# Altium project x-fly.PrjPcb
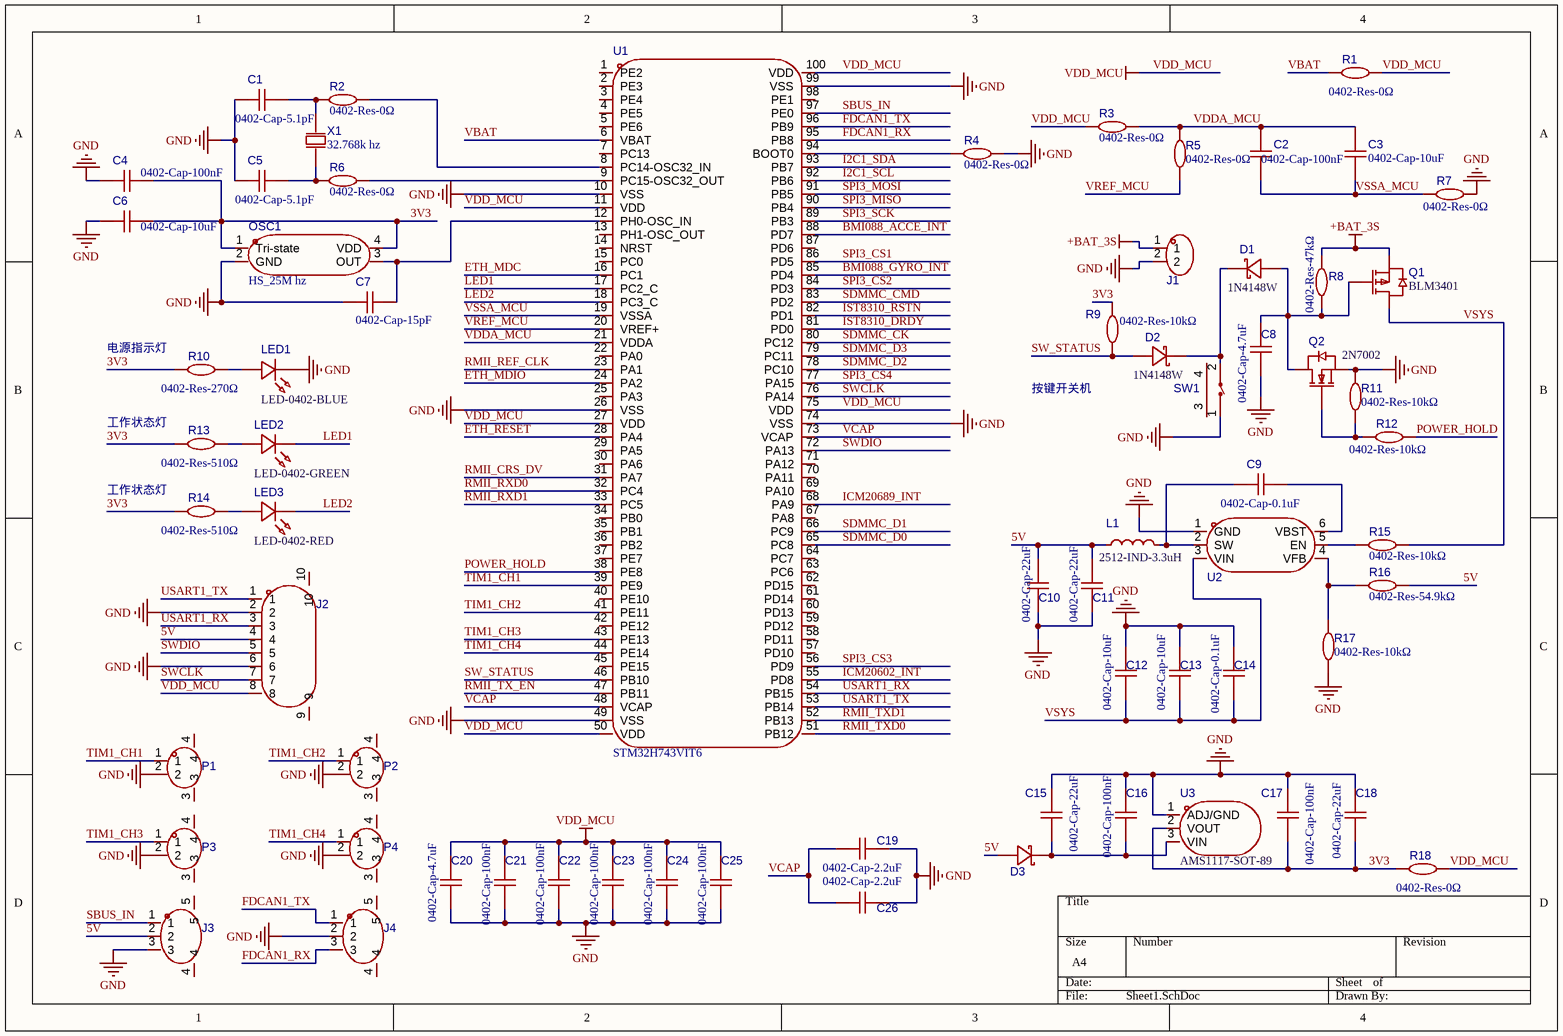
[diagram p0: Sheet1.SchDoc]
3 sheets, 122 parts. Net scope: global (net labels, ports and power ports of the same name join across sheets).
Board file: x-fly_v0.11a.PcbDoc
Sheets:
  Sheet1.SchDoc
  Sheet2.SchDoc
  Sheet3.SchDoc

## Sheet Sheet1.SchDoc: x-fly
size A4; DrawnBy: sushishu; SheetNumber: 1; SheetTotal: 3

### Parts
C1  0402-Cap-5.1pF  [0402-Cap]
C2  0402-Cap-100nF  [0402-Cap]
C3  0402-Cap-10uF  [0402-Cap]
C4  0402-Cap-100nF  [0402-Cap]
C5  0402-Cap-5.1pF  [0402-Cap]
C6  0402-Cap-10uF  [0402-Cap]
C7  0402-Cap-15pF  [0402-Cap]
C8  0402-Cap-4.7uF  [0402-Cap]
C9  0402-Cap-0.1uF  [0402-Cap]
C10  0402-Cap-22uF  [0402-Cap]
C11  0402-Cap-22uF  [0402-Cap]
C12  0402-Cap-10uF  [0402-Cap]
C13  0402-Cap-10uF  [0402-Cap]
C14  0402-Cap-0.1uF  [0402-Cap]
C15  0402-Cap-22uF  [0402-Cap]
C16  0402-Cap-100nF  [0402-Cap]
C17  0402-Cap-100nF  [0402-Cap]
C18  0402-Cap-22uF  [0402-Cap]
C19  0402-Cap-2.2uF  [0402-Cap]
C20  0402-Cap-4.7uF  [0402-Cap]
C21  0402-Cap-100nF  [0402-Cap]
C22  0402-Cap-100nF  [0402-Cap]
C23  0402-Cap-100nF  [0402-Cap]
C24  0402-Cap-100nF  [0402-Cap]
C25  0402-Cap-100nF  [0402-Cap]
C26  0402-Cap-2.2uF  [0402-Cap]
D1  1N4148W  [1N4148W]
D2  1N4148W  [1N4148W]
D3  B5819WS  [B5819WS]  (value not drawn)
J1  XH2.50_2PIN-CZ  [XH2.50_2PIN-CZ]  (value not drawn)
J2  PM1.00-1-8PY  [PM1.00-1-8PY]  (value not drawn)
J3  zx-sh1.0-3pwt  [PM1.00-1-3PY]  (value not drawn)
J4  zx-sh1.0-3pwt  [PM1.00-1-3PY]  (value not drawn)
L1  2512-IND-3.3uH  [2512-IND]
LED1  LED-0402-BLUE  [LED-0402-BLUE]
LED2  LED-0402-GREEN  [LED-0402-GREEN]
LED3  LED-0402-RED  [LED-0402-RED]
OSC1  HS_25M hz  [YXC_HS_25M_3225]
P1  PM1.00-1-2PY  [PM1.00-1-2PY]  (value not drawn)
P2  PM1.00-1-2PY  [PM1.00-1-2PY]  (value not drawn)
P3  PM1.00-1-2PY  [PM1.00-1-2PY]  (value not drawn)
P4  PM1.00-1-2PY  [PM1.00-1-2PY]  (value not drawn)
Q1  BLM3401  [BLM3401]
Q2  2N7002  [2N7002]
R1  0402-Res-0Ω  [0402-Res]
R2  0402-Res-0Ω  [0402-Res]
R3  0402-Res-0Ω  [0402-Res]
R4  0402-Res-0Ω  [0402-Res]
R5  0402-Res-0Ω  [0402-Res]
R6  0402-Res-0Ω  [0402-Res]
R7  0402-Res-0Ω  [0402-Res]
R8  0402-Res-47kΩ  [0402-Res]
R9  0402-Res-10kΩ  [0402-Res]
R10  0402-Res-270Ω  [0402-Res]
R11  0402-Res-10kΩ  [0402-Res]
R12  0402-Res-10kΩ  [0402-Res]
R13  0402-Res-510Ω  [0402-Res]
R14  0402-Res-510Ω  [0402-Res]
R15  0402-Res-10kΩ  [0402-Res]
R16  0402-Res-54.9kΩ  [0402-Res]
R17  0402-Res-10kΩ  [0402-Res]
R18  0402-Res-0Ω  [0402-Res]
SW1  BUTTON-MINI  [button-mini]  (value not drawn)
U1  STM32H743VIT6  [STM32H743VIT6]
U2  TPS563201DDCR  [TPS563201DDCR]  (value not drawn)
U3  AMS1117-SOT-89  [AMS1117-SOT-89]
X1  32.768k hz  [32.768KHZ_2012]

### Nets
+BAT_3S: J1.1 Q1.2(S) R8.2
GND: C1.1 C4.1 C5.1 C6.1 C7.1 C8.1 C10.2 C11.2 C12.1 C13.1 C14.1 C15.2 C16.2 C17.2 C18.2 C19.1 C20.1 C21.1 C22.1 C23.1 C24.1 C25.1 C26.1 J1.2 J2.2 J2.6 J3.3 J4.2 LED1.2 OSC1.2(GND) P1.2 P2.2 P3.2 P4.2 Q2.2(S) R4.2 R7.1 R11.1 R17.1 SW1.1 U1.10(VSS) U1.26(VSS) U1.49(VSS) U1.74(VSS) U1.99(VSS) U2.1(GND) U3.1(ADJ/GND)
VDD_MCU: C20.2 C21.2 C22.2 C23.2 C24.2 C25.2 J2.8 R1.1 R3.1 R18.1 U1.11(VDD) U1.27(VDD) U1.50(VDD) U1.75(VDD) U1.100(VDD)
3V3: C4.2 C6.2 C17.1 C18.1 OSC1.1(Tri-state) OSC1.4(VDD) R9.2 R10.1 R13.1 R14.1 R18.2 U3.2(VOUT)
5V: C10.1 C11.1 D3.1(A) J2.4 J3.2 L1.1 R16.1
BMI088_ACCE_INT: U1.88(PD7)
BMI088_GYRO_INT: U1.85(PD4)
ETH_MDC: U1.16(PC1)
ETH_MDIO: U1.24(PA2)
ETH_RESET: U1.28(PA4)
FDCAN1_RX: J4.3 U1.95(PB8)
FDCAN1_TX: J4.1 U1.96(PB9)
I2C1_SCL: U1.92(PB6)
I2C1_SDA: U1.93(PB7)
ICM20602_INT: U1.55(PD8)
ICM20689_INT: U1.68(PA9)
IST8310_DRDY: U1.81(PD0)
IST8310_RSTN: U1.82(PD1)
LED1: LED2.1(K) U1.17(PC2_C)
LED2: LED3.1(K) U1.18(PC3_C)
POWER_HOLD: R12.1 U1.38(PE8)
RMII_CRS_DV: U1.31(PA7)
RMII_REF_CLK: U1.23(PA1)
RMII_RXD0: U1.32(PC4)
RMII_RXD1: U1.33(PC5)
RMII_TX_EN: U1.47(PB11)
RMII_TXD0: U1.51(PB12)
RMII_TXD1: U1.52(PB13)
SBUS_IN: J3.1 U1.97(PE0)
SDMMC_CK: U1.80(PC12)
SDMMC_CMD: U1.83(PD2)
SDMMC_D0: U1.65(PC8)
SDMMC_D1: U1.66(PC9)
SDMMC_D2: U1.78(PC10)
SDMMC_D3: U1.79(PC11)
SPI3_CS1: U1.86(PD5)
SPI3_CS2: U1.84(PD3)
SPI3_CS3: U1.56(PD9)
SPI3_CS4: U1.77(PA15)
SPI3_MISO: U1.90(PB4)
SPI3_MOSI: U1.91(PB5)
SPI3_SCK: U1.89(PB3)
SW_STATUS: D2.1(A) R9.1 U1.46(PB10)
SWCLK: J2.7 U1.76(PA14)
SWDIO: J2.5 U1.72(PA13)
TIM1_CH1: P1.1 U1.39(PE9)
TIM1_CH2: P2.1 U1.41(PE11)
TIM1_CH3: P3.1 U1.43(PE13)
TIM1_CH4: P4.1 U1.44(PE14)
USART1_RX: J2.3 U1.54(PB15)
USART1_TX: J2.1 U1.53(PB14)
VBAT: R1.2 U1.6(VBAT)
VCAP: C19.2 C26.2 U1.48(VCAP) U1.73(VCAP)
VDDA_MCU: C2.2 C3.2 R3.2 R5.2 U1.21(VDDA)
VREF_MCU: R5.1 U1.20(VREF+)
VSSA_MCU: C2.1 C3.1 R7.2 U1.19(VSSA)
VSYS: C12.2 C13.2 C14.2 Q1.3(D) R15.2 U2.3(VIN)
NetC1_2: C1.2 R2.1 X1.2(OSC2)
NetC5_2: C5.2 R6.1 X1.1(OSC1)
NetC7_2: C7.2 OSC1.3(OUT) U1.12(PH0-OSC_IN)
NetC8_2: C8.2 D1.1(A) Q1.1(G) Q2.3(D) R8.1
NetC9_1: C9.1 U2.6(VBST)
NetC9_2: C9.2 L1.2 U2.2(SW)
NetC15_1: C15.1 C16.1 D3.2(K) U3.3(VIN)
NetD1_2: D1.2(K) D2.2(K) SW1.2
NetLED1_1: LED1.1 R10.2
NetLED2_2: LED2.2(A) R13.2
NetLED3_2: LED3.2(A) R14.2
NetQ2_1: Q2.1(G) R11.2 R12.2
NetR2_2: R2.2 U1.8(PC14-OSC32_IN)
NetR4_1: R4.1 U1.94(BOOT0)
NetR6_2: R6.2 U1.9(PC15-OSC32_OUT)
NetR15_1: R15.1 U2.5(EN)
NetR16_2: R16.2 R17.2 U2.4(VFB)

Not connected (* = marked no-connect by the designer): J2 9 10; J3 4 5; J4 4 5; P1 3 4; P2 3 4; P3 3 4; P4 3 4; SW1 3 4; U1 1(PE2) 2(PE3) 3(PE4) 4(PE5) 5(PE6) 7(PC13) 13(PH1-OSC_OUT) 14(NRST) 15(PC0) 22(PA0) 25(PA3) 29(PA5) 30(PA6) 34(PB0) 35(PB1) 36(PB2) 37(PE7) 40(PE10) 42(PE12) 45(PE15) 57(PD10) 58(PD11) 59(PD12) 60(PD13) 61(PD14) 62(PD15) 63(PC6) 64(PC7) 67(PA8) 69(PA10) 70(PA11) 71(PA12) 87(PD6) 98(PE1)

### Notes on the sheet
- (near R10) 电源指示灯
- 工作状态灯
- 按键开关机

### Library data of the parts
C1-C26 = 0402-Cap: Symbol: CGA0402X5R106M6R3GT
D1 D2 = 1N4148W: 二极管配置:独立式;整流电流:150mA;直流反向耐压(Vr):100V;正向压降(Vf):1.25V@150mA;反向恢复时间(Trr):4ns;; Manufacturer: R+O(宏嘉诚); Symbol: 1N4148W_C7420318; AddInBom: yes; ModelId: 5054d9b7be8b429dad093a54b517b4dd; ModelName: SOD-123_L2.7-W1.6-LS3.7-FD; ModelTransform: 145.669,61.024,0,0,0,0,0,0,0; Diode Configuration: 独立式; Pd - Power Dissipation: 400mW; Current - Rectified: 150mA; Voltage - DC Reverse(Vr): 100V; Non-Repetitive Peak Forward Surge Current: 2A; Reverse Leakage Current (Ir): 1uA@75V; Reverse Recovery Time (trr): 4ns; Operating Junction Temperature Range: -55℃~+150℃; LCSC Part Name: 100V 150mA; SupplierPart: C7420318; ManufacturerPart: 1N4148W; Supplier Footprint: SOD-123; JLCPCB Part Class: Extended Part; Datasheet: https://item.szlcsc.com/datasheet/1N4148W/8397140.html; Supplier: LCSC; ConvertToPcb: yes; FootprintName: SOD-123_L2.7-W1.6-LS3.7-FD; Voltage - Forward(Vf@If): 1.25V@150mA
D3 = B5819WS: 二极管配置:独立式;正向压降(Vf):600mV@1.0A;直流反向耐压(Vr):40V;整流电流:1A;; Manufacturer: R+O(宏嘉诚); Symbol: B5819WS_C7420331; AddInBom: yes; ModelId: 0f2f330c645944df9245ac3c3fec3456; ModelName: SOD-323_L1.7-W1.3-LS2.5-FD; ModelTransform: 98.425,49.2125,0,180,0,0,0,0,0; Diode Configuration: 独立式; Voltage - DC Reverse(Vr): 40V; Current - Rectified: 1A; Reverse Leakage Current (Ir): 1mA@40V; Operating Junction Temperature Range: -55℃~+150℃; Non-Repetitive Peak Forward Surge Current: 10A; LCSC Part Name: 电压:40V 电流:1A; SupplierPart: C7420331; ManufacturerPart: B5819WS; Supplier Footprint: SOD-323; JLCPCB Part Class: Extended Part; Datasheet: https://item.szlcsc.com/datasheet/B5819WS/8397153.html; Supplier: LCSC; ConvertToPcb: yes; FootprintName: SOD-323_L1.7-W1.3-LS2.5-FD; Voltage - Forward(Vf@If): 600mV@1.0A
J1 = XH2.50_2PIN-CZ: 插针结构:1x2P;间距:2.54mm;行距:-;圆针/方针:方针;安装方式:直插;排数:单排;总PIN位数:2P;额定电流:3A;额定电压:-;配合针长度:6mm;塑高:2.5mm;端接针长度:3mm;触头材质:黄铜;触头镀层:金;工作温度:-40℃~+105℃;颜色:黑色;; Manufacturer: Megastar(兆星); Symbol: ZX-PZ2.54-1-2PZZ; AddInBom: yes; ModelId: e35305ec3aa84b66b849f914b715e73f; ModelName: HDR2.54-M-LI-1X2P; ModelTransform: 200,100,0,0,0,0,0,0,-118.11; Pin Structure: 1x2P; Pitch: 2.54mm; Circluar Pins/Square Pins: 方针; Current Rating: 3A; LCSC Part Name: 1x2P 间距:2.54mm 方针 直插; SupplierPart: C7501260; ManufacturerPart: ZX-PZ2.54-1-2PZZ; Supplier Footprint: 插件,P=2.54mm; JLCPCB Part Class: Extended Part; Datasheet: https://item.szlcsc.com/datasheet/ZX-PZ2.54-1-2PZZ/8582473.html; Supplier: LCSC; ConvertToPcb: yes; FootprintName: HDR-TH_2P-P2.54-V-M; Row Spacing: -; Mounting Type: 直插; Number of Rows: 单排; Number of Pins: 2P; Voltage Rating (Max): -; Length of Mating Pin: 6mm; Insulation Height: 2.5mm; Length of End Connection Pin: 3mm; Contact Material: 黄铜; Contact Plating: 金; Operating Temperature: -40℃~+105℃; Color: 黑色
J2 = PM1.00-1-8PY: 插针结构:1x8P;间距:1mm;安装方式:卧贴;参考系列:SH;总PIN数:8P;排数:1;每排PIN数:8;行距:-;额定电流:1A;触头材质:磷铜;触头镀层:锡;工作温度:-40℃~+105℃;; Manufacturer: CJT(长江连接器); ManufacturerPart: A1002WR-S-8P-LCP; Symbol: A1002WR-S-8P; AddInBom: yes; ModelId: 4a02b27f0fd74216a2a7cf264e5e8a60; ModelName: CONN-SMD_SH1.00-WS-8P; ModelTransform: 374.015,196.85,0,0,0,0,0,-6.693,0; Pins Structure: 1x8P; Pitch: 1mm; Reference Series: SH; Number of PINs Per Row: 8; Current Rating: 1A; Voltage Rating: 50V; Plastic Material: LCP; Flame Retardant Rating: UL94V-0; LCSC Part Name: 1x8P 间距:1mm 卧贴 系列:SH; SupplierPart: C239526; Supplier Footprint: SMD,P=1mm,卧贴; JLCPCB Part Class: Extended Part; Datasheet: https://item.szlcsc.com/datasheet/A1002WR-S-8P-LCP/238630.html; Supplier: LCSC; ConvertToPcb: yes; FootprintName: CONN-SMD_A1002WR-S-8P; Mounting Type: 卧贴; Number of Pins: 8P; Number of Rows: 1; Row Spacing: -; Contact Material: 磷铜; Contact Plating: 锡; Operating Temperature: -40℃~+105℃; Color: -
J3 J4 = PM1.00-1-3PY: 插针结构:1x3P;间距:1mm;安装方式:卧贴;参考系列:SH;总PIN数:3P;排数:1;每排PIN数:3;行距:-;额定电流:1A;触头材质:黄铜;触头镀层:锡;工作温度:-40℃~+85℃;; Manufacturer: Megastar(兆星); AddInBom: yes; ModelId: 1278262bd4cd435b96f1008df75d115e; ModelName: CONN-SMD_3P-P1.00_MEGASTAR_ZX-SH1.0-3PWT; ModelTransform: 211.0232,198.8185,0,0,0,0,0.118,-7.874,0; Pins Structure: 1x3P; Pitch: 1mm; Reference Series: SH; Number of PINs Per Row: 3; Current Rating: 1A; Voltage Rating: 50V; Plastic Material: LCP; Supplementary Features: 辅助焊脚; Z-Height of the Board: 3.15mm; X-Length of Bottom Edge on Board (Spacing Line): 5.35mm; Y-Width of Bottom Edge on Board: 4.3mm; Symbol: ZX-SH1.0-3PWT; LCSC Part Name: 1x3P 间距:1mm 卧贴 系列:SH; SupplierPart: C7430445; ManufacturerPart: ZX-SH1.0-3PWT; Supplier Footprint: SMD,P=1mm,卧贴; JLCPCB Part Class: Extended Part; Datasheet: https://item.szlcsc.com/datasheet/ZX-SH1.0-3PWT/8430314.html; Supplier: LCSC; ConvertToPcb: yes; FootprintName: CONN-SMD_3P-P1.00_MEGASTAR_ZX-SH1.0-3PWT; Mounting Type: 卧贴; Number of Pins: 3P; Number of Rows: 1; Row Spacing: -; Contact Material: 黄铜; Contact Plating: 锡; Operating Temperature: -40℃~+85℃; Flame Retardant Rating: -; Color: 米色
L1 = 2512-IND: 电感值:3.3uH;精度:±20%;额定电流:1.5A;饱和电流(Isat):1.7A;类型:磁胶屏蔽电感;; Manufacturer: YJYCOIN(益嘉源); ManufacturerPart: YHNR2512-3R3M; AddInBom: yes; ModelId: a4637a51cdac46ea8dbfd73cca5b141e; ModelName: IND-SMD_L2.5-W2.0_YHNR2512; ModelTransform: 78.74,98.425,0,90,0,0,0,0,0; Value: 3.3uH; Tolerance: ±20%; Current Rating: 1.5A; Current - Saturation(Isat): 1.7A; DC Resistance(DCR): 215mΩ; Type: 磁胶屏蔽电感; LCSC Part Name: 3.3uH ±20% 1.7A; SupplierPart: C18199419; Supplier Footprint: 1005; JLCPCB Part Class: Extended Part; Datasheet: https://item.szlcsc.com/datasheet/YHNR2512-3R3M/19355334.html; Supplier: LCSC; ConvertToPcb: yes; SymbolName: YHNR2512-3R3M; FootprintName: IND-SMD_L2.5-W2.0_YHNR2512
LED1 = LED-0402-BLUE: 灯头类型:-;发光颜色:蓝色;正向压降(Vf):2.6V~3.1V;功率:-;测试电流:5mA;波长:460nm~475nm;二极管配置:独立二极管;透镜颜色:无色透明透镜;色温:-;发光强度:34mcd~100mcd;发光角度:120°;载带方式:正贴;工作温度:-40℃~+85℃;; Manufacturer: Guiguang light(桂光光电); Symbol: GL0402UB01; AddInBom: yes; ModelId: b7ca3c30c6b4443191a5849952e50378; ModelName: LED0402_L1.0-W0.5-H0.4; ModelTransform: 40.1574,19.685,0,0,0,0,0,0,0; Illumination Color: 蓝色; Test Current: 5mA; Diode Configuration: 独立二极管; Lens Color: 无色透明透镜; Viewing Angle: 120°; LCSC Part Name: 0402 蓝灯 高亮; SupplierPart: C51933303; ManufacturerPart: GL0402UB01; Supplier Footprint: 0402; JLCPCB Part Class: Extended Part; Datasheet: https://item.szlcsc.com/datasheet/GL0402UB01/54645999.html; Supplier: LCSC; ConvertToPcb: yes; FootprintName: LED0402-R-RD; Lamp Holder Type: -; Voltage - Forward(Vf): 2.6V~3.1V; Power(Watts): -; Wavelength - Dominant: 460nm~475nm; Peak Wavelength: -; Color Temperature: -; Luminous Intensity: 34mcd~100mcd; Mounting Style: 正贴; Operating Temperature: -40℃~+85℃
LED2 = LED-0402-GREEN: 灯头类型:-;发光颜色:翠绿色;正向压降(Vf):2.6V~3.1V;功率:-;测试电流:5mA;波长:513nm~528nm;二极管配置:独立二极管;透镜颜色:无色透明透镜;色温:-;发光强度:175mcd~430mcd;发光角度:120°;载带方式:正贴;工作温度:-40℃~+85℃;; Manufacturer: Guiguang light(桂光光电); Symbol: GL0402UG01; AddInBom: yes; ModelId: 080bb9bd520f4b34ac21e218e7b036d6; ModelName: LED0402_L1.0-W0.5-H0.2; ModelTransform: 40.1574,19.685,0,0,0,0,0,-0.0005,0; Illumination Color: 翠绿色; Test Current: 5mA; Diode Configuration: 独立二极管; Lens Color: 无色透明透镜; Viewing Angle: 120°; LCSC Part Name: 0402 翠绿 高亮; SupplierPart: C51933302; ManufacturerPart: GL0402UG01; Supplier Footprint: 0402; JLCPCB Part Class: Extended Part; Datasheet: https://item.szlcsc.com/datasheet/GL0402UG01/54645998.html; Supplier: LCSC; ConvertToPcb: yes; FootprintName: LED0402-RD; Lamp Holder Type: -; Voltage - Forward(Vf): 2.6V~3.1V; Power(Watts): -; Wavelength - Dominant: 513nm~528nm; Peak Wavelength: -; Color Temperature: -; Luminous Intensity: 175mcd~430mcd; Mounting Style: 正贴; Operating Temperature: -40℃~+85℃
LED3 = LED-0402-RED: 灯头类型:1.1mmx0.5mm方形灯头;发光颜色:红色;正向压降(Vf):1.8V~2.4V;功率:-;测试电流:20mA;波长:615nm~630nm;二极管配置:独立二极管;透镜颜色:无色透明透镜;色温:-;发光强度:85mcd~210mcd;发光角度:120°;载带方式:正贴;工作温度:-40℃~+85℃;; Manufacturer: Guiguang light(桂光光电); Symbol: GL0402UR01; AddInBom: yes; ModelId: 080bb9bd520f4b34ac21e218e7b036d6; ModelName: LED0402_L1.0-W0.5-H0.2; ModelTransform: 40.1574,19.685,0,0,0,0,0,-0.0005,0; Illumination Color: 红色; Test Current: 20mA; Diode Configuration: 独立二极管; Lens Color: 无色透明透镜; Viewing Angle: 120°; LCSC Part Name: 0402 红灯 高亮; SupplierPart: C51933301; ManufacturerPart: GL0402UR01; Supplier Footprint: 0402; JLCPCB Part Class: Extended Part; Datasheet: https://item.szlcsc.com/datasheet/GL0402UR01/54645997.html; Supplier: LCSC; ConvertToPcb: yes; FootprintName: LED0402-RD; Lamp Holder Type: 1.1mmx0.5mm方形灯头; Voltage - Forward(Vf): 1.8V~2.4V; Power(Watts): -; Wavelength - Dominant: 615nm~630nm; Peak Wavelength: -; Color Temperature: -; Luminous Intensity: 85mcd~210mcd; Mounting Style: 正贴; Operating Temperature: -40℃~+85℃
OSC1 = HS_25M hz: YXC_HS_25M_3225; Symbol: OT2EL4C4JI-111OLP-25M
P1-P4 = PM1.00-1-2PY: 插针结构:1x2P;间距:1mm;安装方式:卧贴;参考系列:SH;总PIN数:2P;排数:1;每排PIN数:2;行距:-;额定电流:1A;触头材质:黄铜;触头镀层:锡;工作温度:-40℃~+85℃;; Manufacturer: Megastar(兆星); Symbol: ZX-SH1.0-2PWT; AddInBom: yes; ModelId: ba479b8c33e5452cbb41f1de8b72e1b9; ModelName: CONN-SMD_2P-P1.00_HX-1.0-2P-WT; ModelTransform: 157.48,204.724,0,0,0,0,-0.005,-14.214,0; Pins Structure: 1x2P; Pitch: 1mm; Reference Series: SH; Number of PINs Per Row: 2; Current Rating: 1A; Voltage Rating: 50V; Plastic Material: LCP; Supplementary Features: 辅助焊脚; Z-Height of the Board: 3.15mm; X-Length of Bottom Edge on Board (Spacing Line): 4.35mm; Y-Width of Bottom Edge on Board: 4.3mm; LCSC Part Name: 1x2P 间距:1mm 卧贴 系列:SH; SupplierPart: C7430444; ManufacturerPart: ZX-SH1.0-2PWT; Supplier Footprint: SMD,P=1mm,卧贴; JLCPCB Part Class: Extended Part; Datasheet: https://item.szlcsc.com/datasheet/ZX-SH1.0-2PWT/8430313.html; Supplier: LCSC; ConvertToPcb: yes; FootprintName: CONN-SMD_2P-P1.00_HX-1.0-2P-WT; Mounting Type: 卧贴; Number of Pins: 2P; Number of Rows: 1; Row Spacing: -; Contact Material: 黄铜; Contact Plating: 锡; Operating Temperature: -40℃~+85℃; Flame Retardant Rating: -; Color: 米色
Q1 = BLM3401: 数量:1个P沟道;漏源电压(Vdss):30V;连续漏极电流(Id):4.2A;导通电阻(RDS(on)):55mΩ@10V;耗散功率(Pd):1.2W;阈值电压(Vgs(th)):1.3V;; Manufacturer: BL(上海贝岭); AddInBom: yes; ModelId: 89cb27a44ab2466697082bb9fd73a7d0; ModelName: SOT-23-3L_L2.9-W1.6-H1.1-LS2.8-P0.95; ModelTransform: 114.173,110.236,0,90,0,0,0,0,0; Number: 1个P沟道; Drain to Source Voltage: 30V; Current - Continuous Drain(Id): 4.2A; Pd - Power Dissipation: 1.2W; Gate Threshold Voltage (Vgs(th)): 1.3V; Gate Charge(Qg): 9.5nC@4.5V; Input Capacitance(Ciss): 950pF; Reverse Transfer Capacitance (Crss@Vds): 75pF; Type: P沟道; Output Capacitance(Coss): 115pF; Vgs: ±20V; Symbol: BLM3401; LCSC Part Name: 1个P沟道 耐压:30V 电流:4.2A; SupplierPart: C90479; ManufacturerPart: BLM3401; Supplier Footprint: SOT-23; JLCPCB Part Class: Extended Part; Datasheet: https://item.szlcsc.com/datasheet/BLM3401/91666.html; Supplier: LCSC; ConvertToPcb: yes; FootprintName: SOT-23-3_L2.9-W1.6-P1.90-LS2.8-BR; RDS(on): 55mΩ@10V; Operating Temperature: -; Configuration: -
Q2 = 2N7002: 数量:1个N沟道;漏源电压(Vdss):60V;连续漏极电流(Id):300mA;导通电阻(RDS(on)):5Ω@10V;耗散功率(Pd):830mW;阈值电压(Vgs(th)):2.5V;; Manufacturer: Nexperia(安世); Symbol: 2N7002,215; AddInBom: yes; ModelId: c62791f0466c4ae2a892c056b845b0ca; ModelName: SOT-23-3P_L2.9-W1.3-H1.0-LS2.4-P0.95; ModelTransform: 98.64468,114.173,0,180,0,0,0.001,-0.002,0; Number: 1个N沟道; Drain to Source Voltage: 60V; Current - Continuous Drain(Id): 300mA; RDS(on): 5Ω@10V; Pd - Power Dissipation: 830mW; Gate Threshold Voltage (Vgs(th)): 2.5V; Input Capacitance(Ciss): 50pF; Reverse Transfer Capacitance (Crss@Vds): 3.5pF; Type: N沟道; Output Capacitance(Coss): 6.8pF; Vgs: ±30V; LCSC Part Name: 1个N沟道 耐压:60V 电流:300mA; SupplierPart: C65189; ManufacturerPart: 2N7002,215; Supplier Footprint: SOT-23; JLCPCB Part Class: Extended Part; Datasheet: https://item.szlcsc.com/datasheet/2N7002%252C215/66260.html; Supplier: LCSC; ConvertToPcb: yes; FootprintName: SOT-23_L2.9-W1.3-P1.90-LS2.4-BR; Gate Charge(Qg): -; Operating Temperature: -65℃~+150℃; Configuration: -
R1-R18 = 0402-Res: Symbol: 0402WGF1002TCE
SW1 = BUTTON-MINI: 电路结构:单刀单掷;按钮形状:方形按钮;作用力:1.6N;安装方式:卧贴;开关长度:5.55mm;开关宽度:1.1mm;开关高度:4mm;带支架:不带支架;触点电流:50mA;额定电压:12V;带灯:无;工作寿命:3万次;; Manufacturer: hanxia(韩下); Symbol: HX TS24CB 160GF; AddInBom: yes; ModelId: f4d7273b903e43c4b88f6833b850897a; ModelName: SW-SMD_HX-TS24CB-160GF; ModelTransform: 218.5035,159.842,0,0,0,0,0,27.205,-39.37; Circuit: 单刀单掷; Actuator Style: 方形按钮; Operating Force: 1.6N; Switch Height: 4mm; with Bracket: 不带支架; Contact Current: 50mA; Voltage Rating: 12V; Actuator/Cap Color: 白色; With Lamp: 无; Life: 3万次; LCSC Part Name: 侧按小贝贝2*4 沉板式3.5mmx4.0mm 160gf; SupplierPart: C25168832; ManufacturerPart: HX TS24CB 160gf; Supplier Footprint: SMD,5.6x2mm; JLCPCB Part Class: Extended Part; Datasheet: https://item.szlcsc.com/datasheet/HX%2520TS24CB%2520160gf/26898574.html; Supplier: LCSC; ConvertToPcb: yes; FootprintName: SW-SMD_HX-TS24CB-160GF; Mounting Type: 卧贴; Length: 5.55mm; Width: 1.1mm; IP Rating: -; Termination Style: SMD接片; Operating Temperature: -25℃~+70℃
U1 = STM32H743VIT6: Symbol: STM32H743VIT6_C114409
U2 = TPS563201DDCR: 功能类型:降压型;工作电压:4.5V~17V;输出电压:768mV~7V;输出电流:3A;输出类型:可调;; Manufacturer: TI(德州仪器); AddInBom: yes; ModelId: 18da8f6c14a34920b3e136b5c401a119; ModelName: SOT-23-6_L2.9-W1.6-H1.5-LS2.8-P0.95; ModelTransform: 110.73671,114.173,0,180,0,0,0.001,-0.003,0; Function: 降压型; Output Current: 3A; Frequency - Switching: 580kHz; Synchronous Rectifier: 是; Number of Outputs: 1; Topology: 降压式; Quiescent Current: 380uA; Switch tube (built-in/external): 内置; Output Type: 可调; Symbol: TPS563201DDCR; LCSC Part Name: 降压型 3A 4.5V~17V; SupplierPart: C116592; ManufacturerPart: TPS563201DDCR; Supplier Footprint: SOT-23-THIN-6; JLCPCB Part Class: Extended Part; Datasheet: https://www.ti.com/cn/lit/ds/symlink/tps563201.pdf; Supplier: LCSC; ConvertToPcb: yes; FootprintName: SOT-23-6_L2.9-W1.6-P0.95-LS2.8-BR; Voltage - Supply: 4.5V~17V; Output Voltage: 768mV~7V; Operating Temperature: -40℃~+125℃@(TJ); Features: 轻载高效模式；逐波限流；过流保护；打嗝限流
U3 = AMS1117-SOT-89: 输出极性:正极;工作电压:15V;输出电压:3.3V;输出电流:1A;电源纹波抑制比(PSRR):-;输出类型:固定;; Manufacturer: MSKSEMI(美森科); ManufacturerPart: AMS1117-3.3V; Symbol: AMS1117-3.3V_C5120796; AddInBom: yes; ModelId: 6db690b7897d4d18a30d90c1b89525ee; ModelName: SOT-89-3_L4.3-W2.5-H1.6-LS4.1-P1.50; ModelTransform: 161.417,169.291,0,180,0,0,-18.661,0,0; Output Configuration: 正极; Voltage - Supply: 15V; Output Voltage: 3.3V; Output Current: 1A; standby current: 12mA; Output Type: 固定; Number of Outputs: 1; LCSC Part Name: 3.3V 1A 15V; SupplierPart: C5120796; Supplier Footprint: SOT-89; JLCPCB Part Class: Extended Part; Datasheet: https://item.szlcsc.com/datasheet/AMS1117-3.3V/5706251.html; Supplier: LCSC; ConvertToPcb: yes; FootprintName: SOT-89-3_L4.5-W2.5-P1.50-LS4.2-BR; Power Supply Rejection Ratio (PSRR): -; Voltage Dropout: -; Noise: -; Features: -; Operating Temperature: 0℃~+125℃@(Ta)
X1 = 32.768k hz: 2012; Symbol: FC-12M32.768KHZ7PF20PPM

## Sheet Sheet2.SchDoc: x-fly
size A4; DrawnBy: sushishu; SheetNumber: 2; SheetTotal: 3
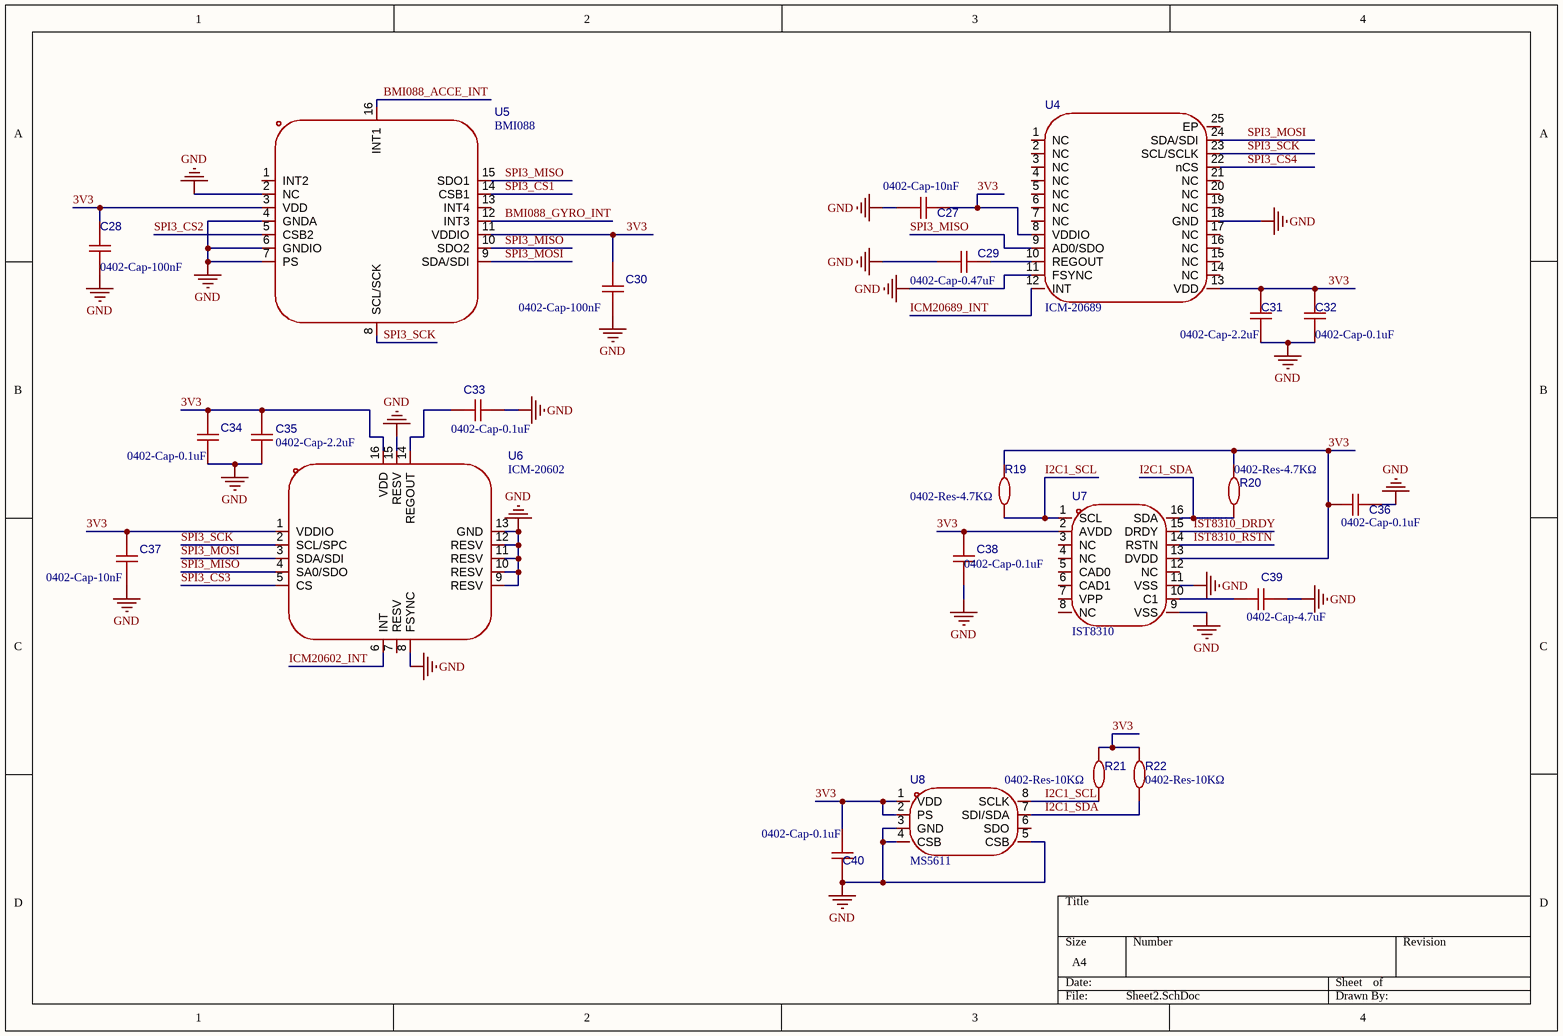
[diagram p1: Sheet2.SchDoc]

### Parts
C27  0402-Cap-10nF  [0402-Cap]
C28  0402-Cap-100nF  [0402-Cap]
C29  0402-Cap-0.47uF  [0402-Cap]
C30  0402-Cap-100nF  [0402-Cap]
C31  0402-Cap-2.2uF  [0402-Cap]
C32  0402-Cap-0.1uF  [0402-Cap]
C33  0402-Cap-0.1uF  [0402-Cap]
C34  0402-Cap-0.1uF  [0402-Cap]
C35  0402-Cap-2.2uF  [0402-Cap]
C36  0402-Cap-0.1uF  [0402-Cap]
C37  0402-Cap-10nF  [0402-Cap]
C38  0402-Cap-0.1uF  [0402-Cap]
C39  0402-Cap-4.7uF  [0402-Cap]
C40  0402-Cap-0.1uF  [0402-Cap]
R19  0402-Res-4.7KΩ  [0402-Res]
R20  0402-Res-4.7KΩ  [0402-Res]
R21  0402-Res-10KΩ  [0402-Res]
R22  0402-Res-10KΩ  [0402-Res]
U4  ICM-20689  [ICM-20689]
U5  BMI088  [BMI088]
U6  ICM-20602  [ICM-20602]
U7  IST8310  [IST8310]
U8  MS5611  [MS5611]

### Nets
GND: C27.2 C28.1 C29.2 C30.1 C31.1 C32.1 C33.2 C34.1 C35.1 C36.1 C37.1 C38.2 C39.2 C40.2 U4.11(FSYNC) U4.18(GND) U5.2(NC) U5.4(GNDA) U5.6(GNDIO) U5.7(PS) U6.8(FSYNC) U6.9(RESV) U6.10(RESV) U6.11(RESV) U6.12(RESV) U6.13(GND) U6.15(RESV) U7.9(VSS) U7.11(VSS) U8.3(GND) U8.4(CSB) U8.5(CSB)
3V3: C27.1 C28.2 C30.2 C31.2 C32.2 C34.2 C35.2 C36.2 C37.2 C38.1 C40.1 R19.2 R20.2 R21.2 R22.1 U4.8(VDDIO) U4.13(VDD) U5.3(VDD) U5.11(VDDIO) U6.1(VDDIO) U6.16(VDD) U7.2(AVDD) U7.13(DVDD) U8.1(VDD) U8.2(PS)
BMI088_ACCE_INT: U5.16(INT1)
BMI088_GYRO_INT: U5.12(INT3)
I2C1_SCL: R19.1 R21.1 U7.1(SCL) U8.8(SCLK)
I2C1_SDA: R20.1 R22.2 U7.16(SDA) U8.7(SDI/SDA)
ICM20602_INT: U6.6(INT)
ICM20689_INT: U4.12(INT)
IST8310_DRDY: U7.15(DRDY)
IST8310_RSTN: U7.14(RSTN)
SPI3_CS1: U5.14(CSB1)
SPI3_CS2: U5.5(CSB2)
SPI3_CS3: U6.5(CS)
SPI3_CS4: U4.22(nCS)
SPI3_MISO: U4.9(AD0/SDO) U5.10(SDO2) U5.15(SDO1) U6.4(SA0/SDO)
SPI3_MOSI: U4.24(SDA/SDI) U5.9(SDA/SDI) U6.3(SDA/SDI)
SPI3_SCK: U4.23(SCL/SCLK) U5.8(SCL/SCK) U6.2(SCL/SPC)
NetC29_1: C29.1 U4.10(REGOUT)
NetC33_1: C33.1 U6.14(REGOUT)
NetC39_1: C39.1 U7.10(C1)

Not connected (* = marked no-connect by the designer): U4 1(NC) 2(NC) 3(NC) 4(NC) 5(NC) 6(NC) 7(NC) 14(NC) 15(NC) 16(NC) 17(NC) 19(NC) 20(NC) 21(NC) 25(EP); U5 1(INT2) 13(INT4); U6 7(RESV); U7 3(NC) 4(NC) 5(CAD0) 6(CAD1) 7(VPP) 8(NC) 12(NC); U8 6(SDO)

### Library data of the parts
C27-C40 = 0402-Cap: Symbol: CGA0402X5R106M6R3GT
R19-R22 = 0402-Res: Symbol: 0402WGF1002TCE
U7 = IST8310: Symbol: IST8310_C2683055
U8 = MS5611: Symbol: MS561101BA03-50
U4 = ICM-20689: Symbol: ICM-20689
U5 = BMI088: Symbol: BMI088
U6 = ICM-20602: Symbol: ICM-20602

## Sheet Sheet3.SchDoc
size A4; SheetNumber: 3; SheetTotal: 3
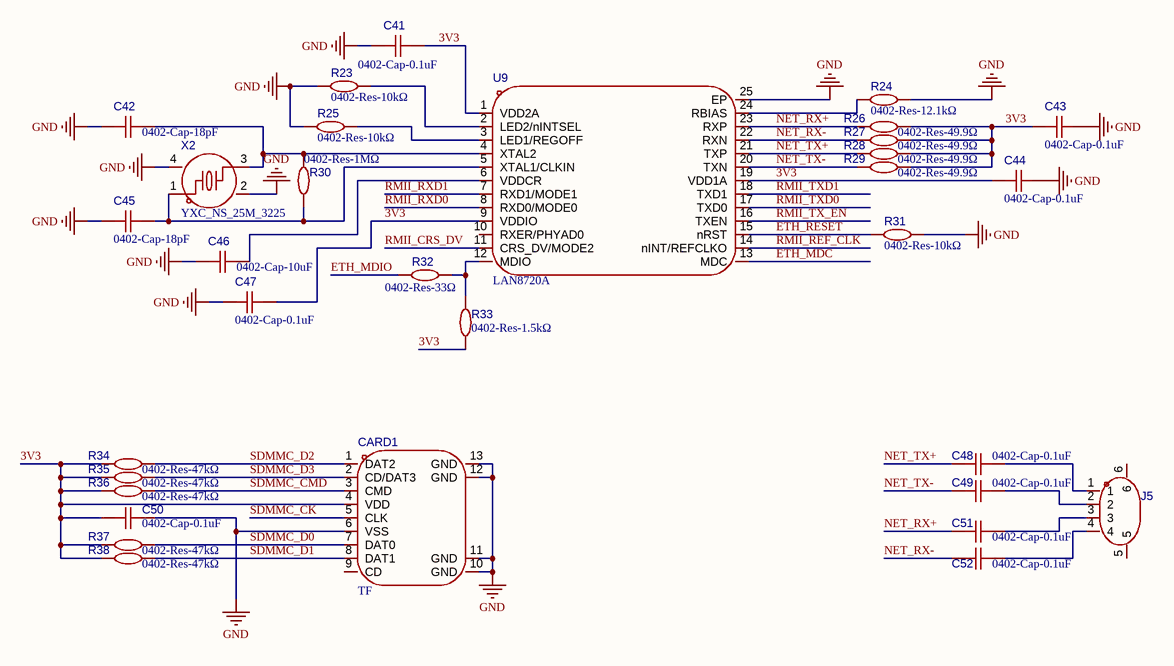
[diagram p2: Sheet3.SchDoc]

### Parts
C41  0402-Cap-0.1uF  [0402-Cap]
C42  0402-Cap-18pF  [0402-Cap]
C43  0402-Cap-0.1uF  [0402-Cap]
C44  0402-Cap-0.1uF  [0402-Cap]
C45  0402-Cap-18pF  [0402-Cap]
C46  0402-Cap-10uF  [0402-Cap]
C47  0402-Cap-0.1uF  [0402-Cap]
C48  0402-Cap-0.1uF  [0402-Cap]
C49  0402-Cap-0.1uF  [0402-Cap]
C50  0402-Cap-0.1uF  [0402-Cap]
C51  0402-Cap-0.1uF  [0402-Cap]
C52  0402-Cap-0.1uF  [0402-Cap]
CARD1  TF  [TF]
J5  PM1.00-1-4PY  [PM1.00-1-4PY]  (value not drawn)
R23  0402-Res-10kΩ  [0402-Res]
R24  0402-Res-12.1kΩ  [0402-Res]
R25  0402-Res-10kΩ  [0402-Res]
R26  0402-Res-49.9Ω  [0402-Res]
R27  0402-Res-49.9Ω  [0402-Res]
R28  0402-Res-49.9Ω  [0402-Res]
R29  0402-Res-49.9Ω  [0402-Res]
R30  0402-Res-1MΩ  [0402-Res]
R31  0402-Res-10kΩ  [0402-Res]
R32  0402-Res-33Ω  [0402-Res]
R33  0402-Res-1.5kΩ  [0402-Res]
R34  0402-Res-47kΩ  [0402-Res]
R35  0402-Res-47kΩ  [0402-Res]
R36  0402-Res-47kΩ  [0402-Res]
R37  0402-Res-47kΩ  [0402-Res]
R38  0402-Res-47kΩ  [0402-Res]
U9  LAN8720A  [LAN8720A]
X2  YXC_NS_25M_3225  [YXC_NS_25M_3225]

### Nets
GND: C41.2 C42.2 C43.2 C44.1 C45.1 C46.2 C47.2 C50.1 CARD1.6(VSS) CARD1.10(GND) CARD1.11(GND) CARD1.12(GND) CARD1.13(GND) R23.2 R24.1 R25.2 R31.1 U9.25(EP) X2.2(GND) X2.4(GND)
3V3: C41.1 C43.1 C44.2 C47.1 C50.2 CARD1.4(VDD) R26.1 R27.1 R28.1 R29.1 R33.2 R34.2 R35.2 R36.2 R37.2 R38.2 U9.1(VDD2A) U9.9(VDDIO) U9.19(VDD1A)
ETH_MDC: U9.13(MDC)
ETH_MDIO: R32.2
ETH_RESET: R31.2 U9.15(nRST)
NET_RX+: C51.2 R26.2 U9.23(RXP)
NET_RX-: C52.2 R27.2 U9.22(RXN)
NET_TX+: C48.2 R28.2 U9.21(TXP)
NET_TX-: C49.2 R29.2 U9.20(TXN)
RMII_CRS_DV: U9.11(CRS_DV/MODE2)
RMII_REF_CLK: U9.14(nINT/REFCLKO)
RMII_RXD0: U9.8(RXD0/MODE0)
RMII_RXD1: U9.7(RXD1/MODE1)
RMII_TX_EN: U9.16(TXEN)
RMII_TXD0: U9.17(TXD0)
RMII_TXD1: U9.18(TXD1)
SDMMC_CK: CARD1.5(CLK)
SDMMC_CMD: CARD1.3(CMD) R36.1
SDMMC_D0: CARD1.7(DAT0) R37.1
SDMMC_D1: CARD1.8(DAT1) R38.1
SDMMC_D2: CARD1.1(DAT2) R34.1
SDMMC_D3: CARD1.2(CD/DAT3) R35.1
NetC42_1: C42.1 R30.2 U9.4(XTAL2) X2.3
NetC45_2: C45.2 R30.1 U9.5(XTAL1/CLKIN) X2.1
NetC46_1: C46.1 U9.6(VDDCR)
NetC48_1: C48.1 J5.1
NetC49_1: C49.1 J5.2
NetC51_1: C51.1 J5.3
NetC52_1: C52.1 J5.4
NetR23_1: R23.1 U9.2(LED2/nINTSEL)
NetR24_2: R24.2 U9.24(RBIAS)
NetR25_1: R25.1 U9.3(LED1/REGOFF)
NetR32_1: R32.1 R33.1 U9.12(MDIO)

Not connected (* = marked no-connect by the designer): CARD1 9(CD); J5 5 6; U9 10(RXER/PHYAD0)

### Library data of the parts
C41-C52 = 0402-Cap: Symbol: CGA0402X5R106M6R3GT
CARD1 = TF: TF-01A_C2889258; Symbol: TF-01A_C2889258
J5 = PM1.00-1-4PY: 插针结构:1x4P;间距:1mm;安装方式:卧贴;参考系列:SH;总PIN数:4P;排数:1;每排PIN数:4;行距:-;额定电流:1A;触头材质:黄铜;触头镀层:锡;工作温度:-40℃~+85℃;; Manufacturer: Megastar(兆星); Symbol: ZX-SH1.0-4PWT; AddInBom: yes; ModelId: 12775bf286e24184ade05a2f5a42ab9d; ModelName: CONN-SMD_4P-P1.00_MEGASTAR_ZX-SH1.0-4PWT; ModelTransform: 250.393,198.8185,0,0,0,0,0.2,-7.877,0; Pins Structure: 1x4P; Pitch: 1mm; Reference Series: SH; Number of PINs Per Row: 4; Current Rating: 1A; Voltage Rating: 50V; Plastic Material: LCP; Supplementary Features: 辅助焊脚; Z-Height of the Board: 3.15mm; X-Length of Bottom Edge on Board (Spacing Line): 6.35mm; Y-Width of Bottom Edge on Board: 4.3mm; LCSC Part Name: 1x4P 间距:1mm 卧贴 系列:SH; SupplierPart: C7430446; ManufacturerPart: ZX-SH1.0-4PWT; Supplier Footprint: SMD,P=1mm,卧贴; JLCPCB Part Class: Extended Part; Datasheet: https://item.szlcsc.com/datasheet/ZX-SH1.0-4PWT/8430315.html; Supplier: LCSC; ConvertToPcb: yes; FootprintName: CONN-SMD_4P-P1.00_MEGASTAR_ZX-SH1.0-4PWT; Mounting Type: 卧贴; Number of Pins: 4P; Number of Rows: 1; Row Spacing: -; Contact Material: 黄铜; Contact Plating: 锡; Operating Temperature: -40℃~+85℃; Flame Retardant Rating: -; Color: 米色
R23-R38 = 0402-Res: Symbol: 0402WGF1002TCE
U9 = LAN8720A: Symbol: LAN8720A-CP-TR
X2 = YXC_NS_25M_3225: XL2EL89CSI-111YLC-25M; Symbol: XL2EL89CSI-111YLC-25M

## Nets that join several sheets
GND: Sheet1 (47 pins), Sheet2 (32 pins), Sheet3 (20 pins)
3V3: Sheet1 (12 pins), Sheet2 (25 pins), Sheet3 (19 pins)
BMI088_ACCE_INT: Sheet1 (U1.88), Sheet2 (U5.16)
BMI088_GYRO_INT: Sheet1 (U1.85), Sheet2 (U5.12)
ETH_MDC: Sheet1 (U1.16), Sheet3 (U9.13)
ETH_MDIO: Sheet1 (U1.24), Sheet3 (R32.2)
ETH_RESET: Sheet1 (U1.28), Sheet3 (R31.2 U9.15)
I2C1_SCL: Sheet1 (U1.92), Sheet2 (R19.1 R21.1 U7.1 U8.8)
I2C1_SDA: Sheet1 (U1.93), Sheet2 (R20.1 R22.2 U7.16 U8.7)
ICM20602_INT: Sheet1 (U1.55), Sheet2 (U6.6)
ICM20689_INT: Sheet1 (U1.68), Sheet2 (U4.12)
IST8310_DRDY: Sheet1 (U1.81), Sheet2 (U7.15)
IST8310_RSTN: Sheet1 (U1.82), Sheet2 (U7.14)
RMII_CRS_DV: Sheet1 (U1.31), Sheet3 (U9.11)
RMII_REF_CLK: Sheet1 (U1.23), Sheet3 (U9.14)
RMII_RXD0: Sheet1 (U1.32), Sheet3 (U9.8)
RMII_RXD1: Sheet1 (U1.33), Sheet3 (U9.7)
RMII_TX_EN: Sheet1 (U1.47), Sheet3 (U9.16)
RMII_TXD0: Sheet1 (U1.51), Sheet3 (U9.17)
RMII_TXD1: Sheet1 (U1.52), Sheet3 (U9.18)
SDMMC_CK: Sheet1 (U1.80), Sheet3 (CARD1.5)
SDMMC_CMD: Sheet1 (U1.83), Sheet3 (CARD1.3 R36.1)
SDMMC_D0: Sheet1 (U1.65), Sheet3 (CARD1.7 R37.1)
SDMMC_D1: Sheet1 (U1.66), Sheet3 (CARD1.8 R38.1)
SDMMC_D2: Sheet1 (U1.78), Sheet3 (CARD1.1 R34.1)
SDMMC_D3: Sheet1 (U1.79), Sheet3 (CARD1.2 R35.1)
SPI3_CS1: Sheet1 (U1.86), Sheet2 (U5.14)
SPI3_CS2: Sheet1 (U1.84), Sheet2 (U5.5)
SPI3_CS3: Sheet1 (U1.56), Sheet2 (U6.5)
SPI3_CS4: Sheet1 (U1.77), Sheet2 (U4.22)
SPI3_MISO: Sheet1 (U1.90), Sheet2 (U4.9 U5.10 U5.15 U6.4)
SPI3_MOSI: Sheet1 (U1.91), Sheet2 (U4.24 U5.9 U6.3)
SPI3_SCK: Sheet1 (U1.89), Sheet2 (U4.23 U5.8 U6.2)